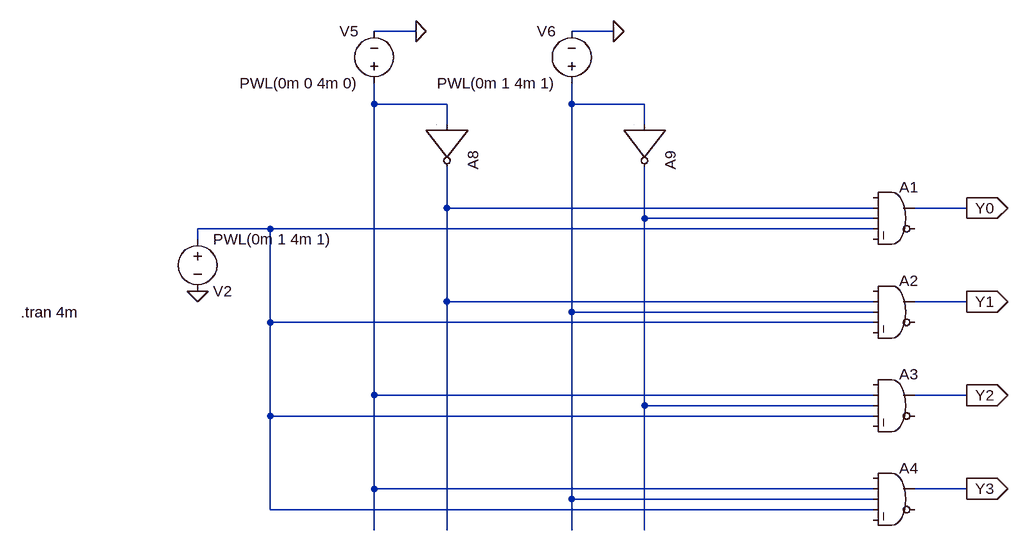
[diagram p0: schematic demux1.asc]
demux1.asc, the LTspice schematic file:
Version 4.1
SHEET 1 880 752
WIRE -528 -96 -592 -96
WIRE -224 -96 -288 -96
WIRE -592 16 -592 -16
WIRE -480 16 -592 16
WIRE -288 16 -288 -16
WIRE -176 16 -288 16
WIRE -480 48 -480 16
WIRE -176 48 -176 16
WIRE -480 176 -480 112
WIRE 176 176 -480 176
WIRE 320 176 240 176
WIRE -176 192 -176 112
WIRE 176 192 -176 192
WIRE -752 208 -864 208
WIRE 176 208 -752 208
WIRE -864 224 -864 208
WIRE -480 320 -480 176
WIRE 176 320 -480 320
WIRE 320 320 240 320
WIRE -288 336 -288 16
WIRE 176 336 -288 336
WIRE -752 352 -752 208
WIRE 176 352 -752 352
WIRE -592 464 -592 16
WIRE 176 464 -592 464
WIRE 320 464 240 464
WIRE -176 480 -176 192
WIRE 176 480 -176 480
WIRE -752 496 -752 352
WIRE 176 496 -752 496
WIRE -592 608 -592 464
WIRE 176 608 -592 608
WIRE 320 608 240 608
WIRE -288 624 -288 336
WIRE 176 624 -288 624
WIRE -752 640 -752 496
WIRE 176 640 -752 640
WIRE -592 672 -592 608
WIRE -480 672 -480 320
WIRE -288 672 -288 624
WIRE -176 672 -176 480
FLAG -528 -96 0
FLAG -224 -96 0
FLAG -864 304 0
FLAG 320 176 Y0
IOPIN 320 176 Out
FLAG 320 320 Y1
IOPIN 320 320 Out
FLAG 320 464 Y2
IOPIN 320 464 Out
FLAG 320 608 Y3
IOPIN 320 608 Out
SYMBOL Digital\\and 208 128 R0
SYMATTR InstName A1
SYMBOL Digital\\and 208 272 R0
SYMATTR InstName A2
SYMBOL Digital\\and 208 416 R0
SYMATTR InstName A3
SYMBOL Digital\\and 208 560 R0
SYMATTR InstName A4
SYMBOL Digital\\inv -416 48 R90
SYMATTR InstName A8
SYMBOL Digital\\inv -112 48 R90
SYMATTR InstName A9
SYMBOL voltage -592 0 R180
WINDOW 0 24 96 Left 2
WINDOW 3 24 16 Left 2
WINDOW 123 0 0 Left 0
WINDOW 39 0 0 Left 0
SYMATTR InstName V5
SYMATTR Value PWL(0m 0 4m 0)
SYMBOL voltage -288 0 R180
WINDOW 0 24 96 Left 2
WINDOW 3 24 16 Left 2
WINDOW 123 0 0 Left 0
WINDOW 39 0 0 Left 0
SYMATTR InstName V6
SYMATTR Value PWL(0m 1 4m 1)
SYMBOL voltage -864 208 R0
WINDOW 0 24 96 Left 2
WINDOW 3 24 16 Left 2
WINDOW 123 0 0 Left 0
WINDOW 39 0 0 Left 0
SYMATTR InstName V2
SYMATTR Value PWL(0m 1 4m 1)
TEXT -1136 336 Left 2 !.tran 4m

The netlist it stands for:
* demux1.asc
A1 0 N003 N004 N005 0 0 Y0 0 AND
A2 0 N003 N002 N005 0 0 Y1 0 AND
A3 0 N001 N004 N005 0 0 Y2 0 AND
A4 0 N001 N002 N005 0 0 Y3 0 AND
A8 N001 0 0 0 0 N003 0 0 BUF
A9 N002 0 0 0 0 N004 0 0 BUF
V5 N001 0 PWL(0m 0 4m 0)
V6 N002 0 PWL(0m 1 4m 1)
V2 N005 0 PWL(0m 1 4m 1)
.tran 4m
.backanno
.end